# EasyEDA Pro project reference-carrier.epro, schematic 扩展板
Create Date: 2023-04-24; Page Name: P1; Project Name: [单片机] ESP32-S3-WROOM-1 开发板; Schematic Name: 扩展板; Update Date: 2023-06-04; Company: 嘉立创EDA; Page Size: A4; Version: V1.0
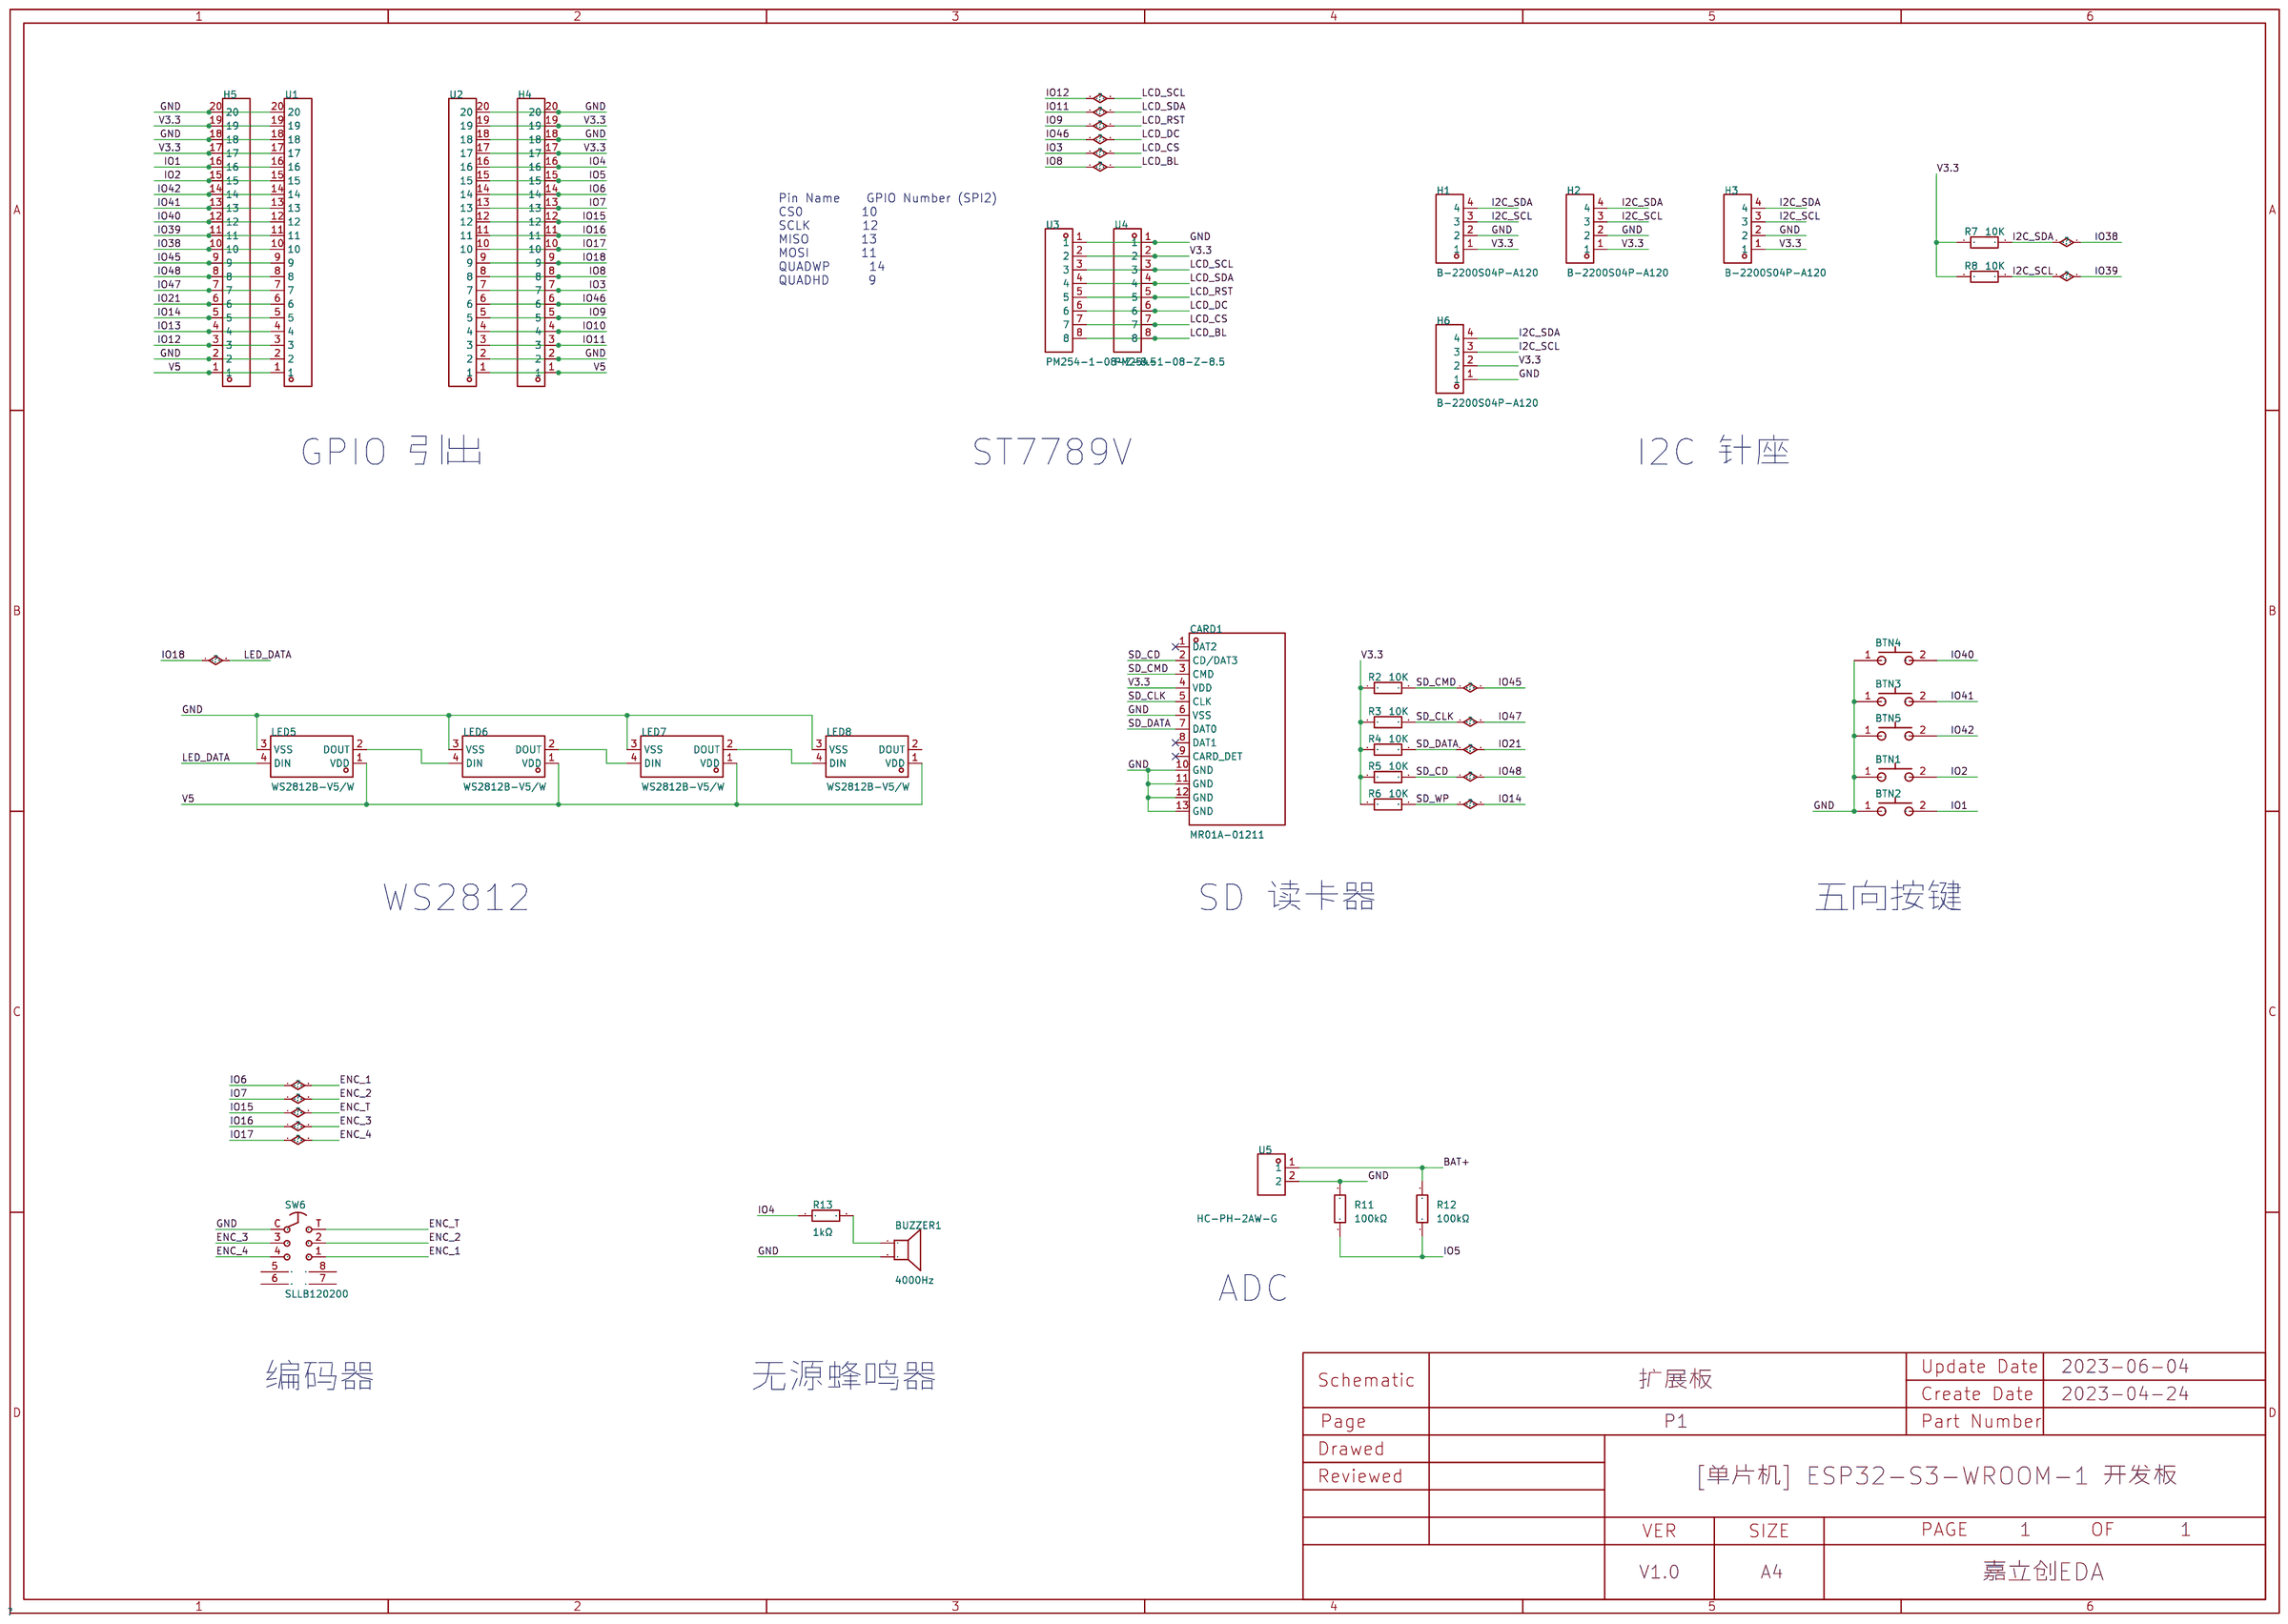
[diagram p1: schematic sheet]

## Parts
BTN1  GT-TC029B-H025-L1N  [SW-SMD_L3.9-W3.0-P4.45]
BTN2  GT-TC029B-H025-L1N  [SW-SMD_L3.9-W3.0-P4.45]
BTN3  GT-TC029B-H025-L1N  [SW-SMD_L3.9-W3.0-P4.45]
BTN4  GT-TC029B-H025-L1N  [SW-SMD_L3.9-W3.0-P4.45]
BTN5  GT-TC029B-H025-L1N  [SW-SMD_L3.9-W3.0-P4.45]
BUZZER1  4000Hz  [BUZ-TH_BD12.5-P6.50-D0.9]
CARD1  MR01A-01211  [TF-SMD_MR01A-01211]
H1  B-2200S04P-A120  [HDR-TH_4P-P2.54-V-F]
H2  B-2200S04P-A120  [HDR-TH_4P-P2.54-V-F]
H3  B-2200S04P-A120  [HDR-TH_4P-P2.54-V-F]
H4  X6511WV-20H-C30D60  [HDR-TH_20P-P2.54-V-M]
H5  X6511WV-20H-C30D60  [HDR-TH_20P-P2.54-V-M]
H6  B-2200S04P-A120  [HDR-TH_4P-P2.54-V-F]
LED5  WS2812B-V5/W  [LED-SMD_4P-L5.0-W5.0-TL-1]
LED6  WS2812B-V5/W  [LED-SMD_4P-L5.0-W5.0-TL-1]
LED7  WS2812B-V5/W  [LED-SMD_4P-L5.0-W5.0-TL-1]
LED8  WS2812B-V5/W  [LED-SMD_4P-L5.0-W5.0-TL-1]
R2  10K  [R0805]
R3  10K  [R0805]
R4  10K  [R0805]
R5  10K  [R0805]
R6  10K  [R0805]
R7  10K  [R0805]
R8  10K  [R0805]
R11  100kΩ  [R0805]
R12  100kΩ  [R0805]
R13  1kΩ  [R0805]
SW6  SLLB120200  [SW-SMD_SLLB120200]
U1  PM254-1-20-Z-8.5  [HDR-TH_20P-P2.54-V-F-2]
U2  PM254-1-20-Z-8.5  [HDR-TH_20P-P2.54-V-F-2]
U3  PM254-1-08-Z-8.5  [HDR-TH_8P-P2.54-V-F]
U4  PM254-1-08-Z-8.5  [HDR-TH_8P-P2.54-V-F]
U5  HC-PH-2AW-G  [CONN-TH_2P-P2.00_HC-PH-2AW-G]

## Library data of the parts
BTN1-BTN5 = GT-TC029B-H025-L1N: 触点电流:50mA;额定电压(DC):12V;绝缘电阻:100MΩ;电路结构:单刀单掷;安装方式:立贴;带灯:无;作用力:250gf@±30gf;机械寿命:10万次;带支架:否;; LCSC Part Name: 3.9*2.9*2.5mm 立贴 轻触开关; Supplier Part: C843669; Manufacturer: G-Switch(品赞); Supplier Footprint: SMD; JLCPCB Part Class: Extended Part; Datasheet: https://atta.szlcsc.com/upload/public/pdf/source/20201014/C843665_B07D254A2E90B746498E934B945CCD5F.pdf; Supplier: LCSC; Contact Current: 50mA; Voltage Rating (DC): 12V; Insulation Resistance: 100MΩ; Circuit: 单刀单掷; Mounting Style: 立贴; Actuator Style: 圆形按钮; Actuator/Cap Color: 黑色; With Lamp: 无; Operating Force: 250gf@±30gf; Mechanical Life: 10万次; Operating Temperature: -30℃~+85℃; Pin Style: SMD接片; Switch Length: 3.9mm; Switch Width: 2.9mm; Switch Height: 2.5mm; Strike Gundam: 否
BUZZER1 = SFN-12055PA6.5: 驱动方式:无源(外部驱动);构造类型:压电式;额定电压:5V;频率:4000Hz;声压(SPL):80dB@5V,10cm;直径(φD):12.5mm;高度:6mm;; LCSC Part Name: 压电无源蜂鸣器; Supplier Part: C360607; Manufacturer: S&S(海旭); Supplier Footprint: 插件,P=6.5mm; JLCPCB Part Class: Extended Part; Datasheet: https://atta.szlcsc.com/upload/public/pdf/source/20220225/D801AF3A55A67CFB490E002F7E7725D1.pdf; Supplier: LCSC; Oscillator Circuit: 无源(外部驱动); Technology Type: 压电式; Rated Voltage: 5V; Sound Pressure Level (SPL): 80dB@5V,10cm; Diameter (φD): 12.5mm; Height: 6mm
CARD1 = MR01A-01211: 卡类型:MicroSD卡(TF卡);连接器类型:卡座;卡连接方式:自弹式;本体最大高度:1.85mm;工作温度范围:-25℃~+85℃;; Supplier Part: C479742; Manufacturer: ATOM(爱特姆); Supplier Footprint: SMD; JLCPCB Part Class: Extended Part; Datasheet: https://atta.szlcsc.com/upload/public/pdf/source/20200107/C479742_0284EDD146B0D8F7A9D47B481AEA01A2.pdf; Supplier: LCSC; Card Type: MicroSD卡(TF卡); Connector Type: 卡座; Card Connection Mode: 自弹式; Maximum Body Height: 1.85mm; Operating Temperature Range: -25℃~+85℃
H1-H3 H6 = B-2200S04P-A120: 排数:单排;总孔位数:4;间距:2.54mm;插孔结构:1x4P;行距:-;安装类型:直插;塑高:-;触头材质:黄铜;触头镀层:-;; LCSC Part Name: 2.54mm 1x4P; Supplier Part: C124413; Manufacturer: Ckmtw(灿科盟); Supplier Footprint: 直插,P=2.54mm; JLCPCB Part Class: Extended Part; Datasheet: https://atta.szlcsc.com/upload/public/pdf/source/20170821/C124413_1503303324882901567.pdf; Supplier: LCSC; Number of Rows: 单排; Number of Holes: 4; Pitch: 2.54mm; Holes Structure: 1x4P; Mounting Type: 直插; Contact Material: 黄铜
H4 H5 = X6511WV-20H-C30D60: 排数:单排;总PIN位数:20;间距:2.54mm;插针结构:1x20P;行距:-;安装类型:直插;圆针/方针:方针;额定电流:3A;额定电压:250V;配合针长度:6mm;塑高:2.5mm;端接针长度:3mm;触头材质:黄铜;触头镀层:金;工作温度范围:-40℃~+105℃;焊接温度(最大值):260℃;颜色:黑色;; LCSC Part Name: 2.54mm 1x20P 直插 方针 高镀金 抗氧化; Supplier Part: C725952; Manufacturer: XKB Connectivity(中国星坤); Supplier Footprint: 插件,P=2.54mm; JLCPCB Part Class: Extended Part; Datasheet: https://atta.szlcsc.com/upload/public/pdf/source/20211009/D19569EFFEB9776B42364DF7D41FD96A.pdf; Supplier: LCSC; Number of Rows: 单排; Number of Pins: 20; Pitch: 2.54mm; Pin Structure: 1x20P; Mounting Type: 直插; Circluar Pins/Square Pins: 方针; Current Rating (Max): 3A; Voltage Rating (Max): 250V; Length of Mating Pin: 6mm; Insulation Height: 2.5mm; Length of End Connection Pin: 3mm; Contact Material: 黄铜; Contact Plating: 金; Operating Temperature Range: -40℃~+105℃; Welding Temperature (Max): 260℃; Color: 黑色
LED5-LED8 = WS2812B-V5/W: LCSC Part Name: RGB三色 （注意防潮，请查阅规格书中对应具体内容）; Supplier Part: C2874885; Manufacturer: worldsemi; Supplier Footprint: SMD5050; JLCPCB Part Class: Extended Part; Datasheet: https://atta.szlcsc.com/upload/public/pdf/source/20220607/7C249E7978D02183621563743847A955.pdf; Supplier: LCSC
R2-R8 = 0805W8F510KT5E: LCSC Part Name: 5.1Ω(5R10) ±1% 编带; Supplier Part: C17724; Manufacturer: UNI-ROYAL(厚声); Supplier Footprint: 0805; JLCPCB Part Class: Basic Part; Datasheet: https://atta.szlcsc.com/upload/public/pdf/source/20170920/C17724_1505887215123980079.pdf; Supplier: LCSC
R11 R12 = 0805W8F1003T5E: 电阻类型:厚膜电阻;阻值:100kΩ;精度:±1%;功率:125mW;; LCSC Part Name: 100kΩ ±1% 125mW; Supplier Part: C149504; Manufacturer: UNI-ROYAL(厚声); Supplier Footprint: 0805; JLCPCB Part Class: Basic Part; Datasheet: https://atta.szlcsc.com/upload/public/pdf/source/20200306/C422600_1E6D84923E4A46A82E41ADD87F860B5C.pdf; Supplier: LCSC; Type: 厚膜电阻; Tolerance: ±1%; Power(Watts): 125mW; Temperature Coefficient: ±100ppm/℃; Overload Voltage (Max): 150V; Operating Temperature Range: -55℃~+155℃
R13 = 0805W8F1001T5E: 电阻类型:厚膜电阻;阻值:1kΩ;精度:±1%;功率:125mW;; LCSC Part Name: 1kΩ ±1% 125mW; Supplier Part: C17513; Manufacturer: UNI-ROYAL(厚声); Supplier Footprint: 0805; JLCPCB Part Class: Basic Part; Datasheet: https://atta.szlcsc.com/upload/public/pdf/source/20200306/C422600_1E6D84923E4A46A82E41ADD87F860B5C.pdf; Supplier: LCSC; Type: 厚膜电阻; Tolerance: ±1%; Power(Watts): 125mW; Temperature Coefficient: ±100ppm/℃; Overload Voltage (Max): 150V; Operating Temperature Range: -55℃~+155℃
SW6 = SLLB120200: LCSC Part Name: 多功能操作装置; Supplier Part: C310813; Manufacturer: ALPSALPINE(阿尔卑斯阿尔派); Supplier Footprint: SMD; JLCPCB Part Class: Extended Part; Datasheet: https://atta.szlcsc.com/upload/public/pdf/source/20181015/C310813_E1A275FBBBD34A0824F326C96E823A9C.pdf; Supplier: LCSC
U1 U2 = PM254-1-20-Z-8.5: 排数:单排;总孔位数:20;间距:2.54mm;插孔结构:1x20P;行距:-;安装类型:直插;圆孔/方孔:方孔;额定电流:3A;额定电压:-;插孔方向:顶部;塑高:8.5mm;工作温度范围:-40℃~+105℃;; LCSC Part Name: 2.54mm 1x20P; Supplier Part: C2897383; Manufacturer: HCTL(华灿天禄); Supplier Footprint: 插件,P=2.54mm; JLCPCB Part Class: Extended Part; Datasheet: https://atta.szlcsc.com/upload/public/pdf/source/20210927/A587EC018F0ED68DBE3C69C90D2D513F.pdf; Supplier: LCSC; Number of Rows: 单排; Number of Holes: 20; Pitch: 2.54mm; Holes Structure: 1x20P; Mounting Type: 直插; Circular Hole / Square Hole: 方孔; Current Rating (Max): 3A; Holes Direction: 顶部; Insulation Height: 8.5mm; Operating Temperature Range: -40℃~+105℃
U3 U4 = PM254-1-08-Z-8.5: 排数:单排;总孔位数:8;间距:2.54mm;插孔结构:1x8P;行距:-;安装类型:直插;圆孔/方孔:方孔;额定电流:3A;额定电压:-;插孔方向:顶部;塑高:8.5mm;工作温度范围:-40℃~+105℃;; LCSC Part Name: 2.54mm 1x8P; Supplier Part: C2897371; Manufacturer: HCTL(华灿天禄); Supplier Footprint: 直插,P=2.54mm; JLCPCB Part Class: Extended Part; Datasheet: https://atta.szlcsc.com/upload/public/pdf/source/20210927/A587EC018F0ED68DBE3C69C90D2D513F.pdf; Supplier: LCSC; Number of Rows: 单排; Number of Holes: 8; Pitch: 2.54mm; Holes Structure: 1x8P; Mounting Type: 直插; Circular Hole / Square Hole: 方孔; Current Rating (Max): 3A; Holes Direction: 顶部; Insulation Height: 8.5mm; Operating Temperature Range: -40℃~+105℃
U5 = HC-PH-2AW-G: 参考系列：PH 间距：2.0mm 插针结构：1x2P 排数：1 每排PIN数：2 触头材质：黄铜  镀锡 PH连接器 PH2.0 耐高温; Supplier Part: C5342442; Manufacturer: HCTL(华灿天禄); Supplier Footprint: 弯插,P=2mm; Supplier: LCSC

## Nets
GND: BTN1.1 BTN2.1 BTN3.1 BTN4.1 BTN5.1 BUZZER1.2 CARD1.6(VSS) CARD1.10(GND) CARD1.11(GND) CARD1.12(GND) CARD1.13(GND) H1.2 H2.2 H3.2 H4.2 H4.18 H4.20 H5.2 H5.18 H5.20 H6.1 LED5.3(VSS) LED6.3(VSS) LED7.3(VSS) LED8.3(VSS) R11.2 SW6.C U1.2 U1.18 U1.20 U2.2 U2.18 U2.20 U3.1 U4.1 U5.2
V3.3: CARD1.4(VDD) H1.1 H2.1 H3.1 H4.17 H4.19 H5.17 H5.19 H6.2 R2.1 R3.1 R4.1 R5.1 R6.1 R7.1 R8.1 U1.17 U1.19 U2.17 U2.19 U3.2 U4.2
V5: H4.1 H5.1 LED5.1(VDD) LED6.1(VDD) LED7.1(VDD) LED8.1(VDD) U1.1 U2.1
BAT+: R12.2 U5.1
ENC_1: H4.14 SW6.1 U2.14
ENC_2: H4.13 SW6.2 U2.13
ENC_3: H4.11 SW6.3 U2.11
ENC_4: H4.10 SW6.4 U2.10
ENC_T: H4.12 SW6.T U2.12
I2C_SCL: H1.3 H2.3 H3.3 H5.11 H6.3 R8.2 U1.11
I2C_SDA: H1.4 H2.4 H3.4 H5.10 H6.4 R7.2 U1.10
IO1: BTN2.2 H5.16 U1.16
IO2: BTN1.2 H5.15 U1.15
IO3: H4.7 U2.7 U3.7 U4.7
IO4: H4.16 R13.1 U2.16
IO5: H4.15 R11.1 R12.1 U2.15
IO8: H4.8 U2.8 U3.8 U4.8
IO9: H4.5 U2.5 U3.5 U4.5
IO10: H4.4 U2.4
IO11: H4.3 U2.3 U3.4 U4.4
IO12: H5.3 U1.3 U3.3 U4.3
IO13: H5.4 U1.4
IO14: H5.5 R6.2 U1.5
IO18: H4.9 LED5.4(DIN) U2.9
IO21: CARD1.7(DAT0) H5.6 R4.2 U1.6
IO40: BTN4.2 H5.12 U1.12
IO41: BTN3.2 H5.13 U1.13
IO42: BTN5.2 H5.14 U1.14
IO45: CARD1.3(CMD) H5.9 R2.2 U1.9
IO46: H4.6 U2.6 U3.6 U4.6
IO47: CARD1.5(CLK) H5.7 R3.2 U1.7
IO48: CARD1.2(CD/DAT3) H5.8 R5.2 U1.8
$1N855: LED5.2(DOUT) LED6.4(DIN)
$1N863: LED6.2(DOUT) LED7.4(DIN)
$1N934: LED7.2(DOUT) LED8.4(DIN)
$1N5497: BUZZER1.1 R13.2

Not connected (* = marked no-connect by the designer): CARD1 1(DAT2)* 8(DAT1)* 9(CARD_DET)*; LED8 2(DOUT); SW6 5 6 7 8

## Notes on the sheet
- Pin Name    GPIO Number (SPI2)
  CS0         10
  SCLK        12
  MISO        13
  MOSI        11
  QUADWP      14
  QUADHD      9
- GPIO 引出
- ST7789V
- I2C 针座
- WS2812
- SD 读卡器
- 五向按键
- ADC
- 编码器
- 无源蜂鸣器
